# Altium schematic sheet Water.SchDoc
size A; SheetNumber: 1; SheetTotal: 2
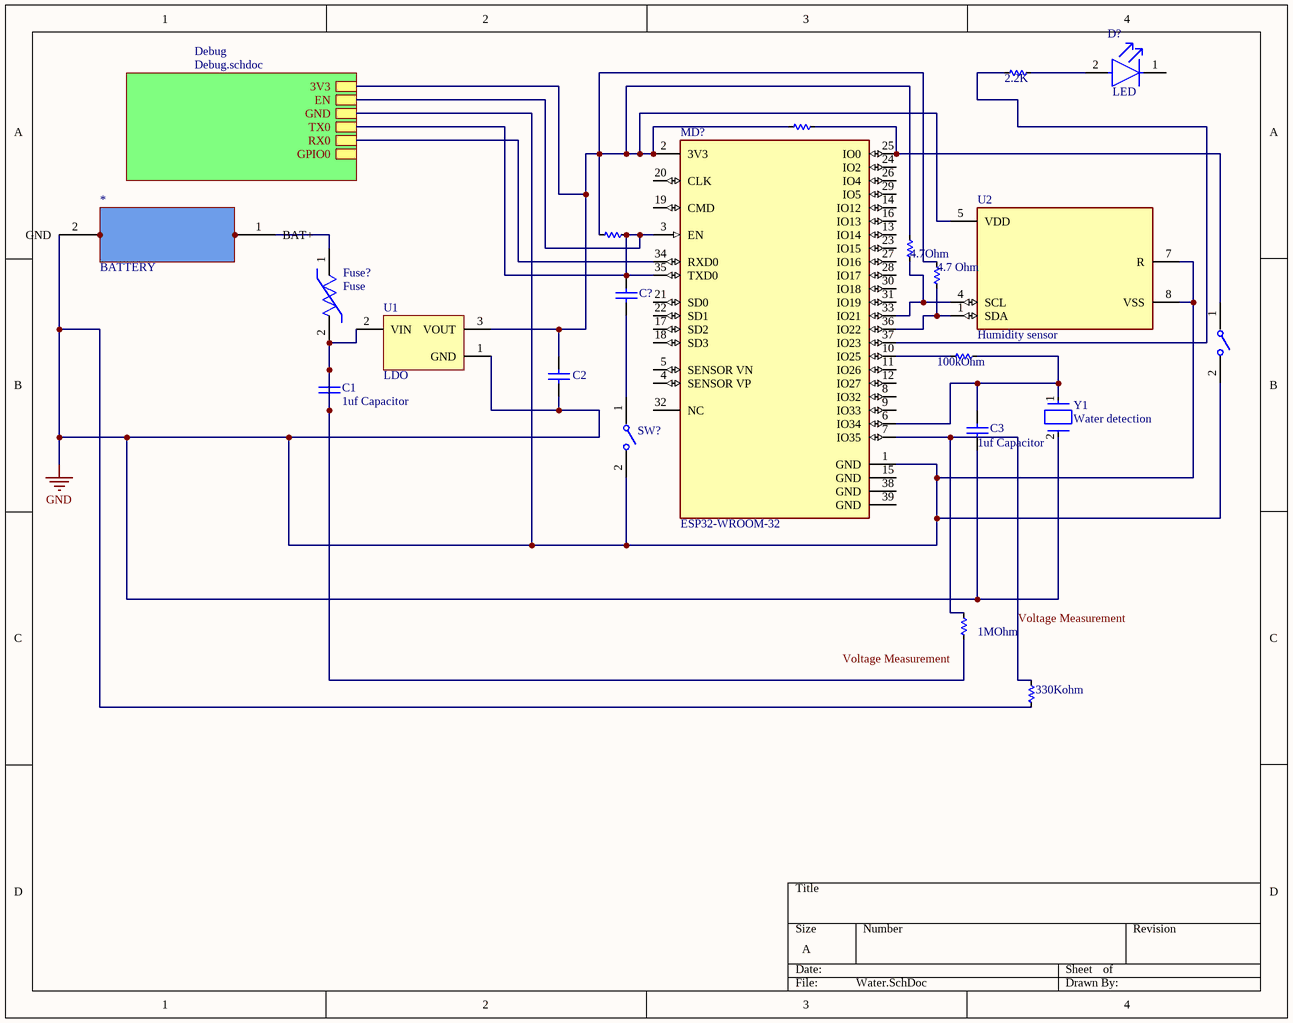
[diagram p0: Water.SchDoc]

## Parts
1MOhm  (no value)  [RESC_0603(1608)_020(0.5)]
2.2K  (no value)  [RESC_0603(1608)_020(0.5)]
4.7_Ohm  (no value)  [RESC_0603(1608)_020(0.5)]
4.7Ohm  (no value)  [RESC_0603(1608)_020(0.5)]
10kOhm  (no value)  [RESC_0603(1608)_020(0.5)]
100kOhm  (no value)  [RESC_0603(1608)_020(0.5)]
330Kohm  (no value)  [RESC_0603(1608)_020(0.5)]
*  BATTERY  [BATTERY_2PIN]
?  (no value)  [RESC_0603(1608)_020(0.5)]
C1  1uf Capacitor  [CAPC2013X140X50NL20T25]
C2  1uf Capacitor  [CAPC2013X140X50NL20T25]  (value not drawn)
C3  1uf Capacitor  [CAPC2013X140X50NL20T25]
C?  1uf  [CAPC2013X140X50NL20T25]  (value not drawn)
D?  LED  [FP-6_544-5255_01-4-MFG]
Fuse?  Fuse  [FP-RXEF250-MFG]
MD?  ESP32-WROOM-32  [FP-ESP32-WROOM-32-MFG]
reset_button  Reset Button  [FP-B3U-1000P-MFG]  (value not drawn)
SW?  Reset Button  [FP-B3U-1000P-MFG]  (value not drawn)
U1  LDO  [TO-92-TO3]
U2  Humidity sensor  [FP-SHT31-DIS-B2_5KS-MFG]
Y1  Water detection  [FP-ECX-64A-MFG]

## Sub-sheets
Debug = Debug.schdoc: 3V3, EN, GND, TX0, RX0, GPIO0

## Nets
GND: 330Kohm.1 *.2(GND) C2.1 C3.1 MD?.1(GND) reset_button.2 SW?.2 U1.1(GND) U2.7(R) U2.8(VSS) Y1.2(Out/In) ; sheet Debug/GND
Voltage Measurement: 1MOhm.1 330Kohm.2 MD?.7(IO35)
Net1MOhm_2: 1MOhm.2 C1.1 C1.2 Fuse?.2 U1.2(VIN)
Net2.2K_1: 2.2K.1 MD?.37(IO23)
Net2.2K_2: 2.2K.2 D?.2(A)
Net4.7_Ohm_1: 4.7_Ohm.1 4.7Ohm.1 10kOhm.2 ?.2 C2.2 MD?.2(3V3) U1.3(VOUT) U2.5(VDD) ; sheet Debug/3V3
Net4.7_Ohm_2: 4.7_Ohm.2 MD?.36(IO22) U2.1(SDA)
Net4.7Ohm_2: 4.7Ohm.2 MD?.33(IO21) U2.4(SCL)
Net10kOhm_1: 10kOhm.1 MD?.25(IO0) reset_button.1
Net100kOhm_1: 100kOhm.1 C3.2 MD?.6(IO34) Y1.1(In/Out)
Net100kOhm_2: 100kOhm.2 MD?.10(IO25)
Net*_1: *.1(BAT+) Fuse?.1
Net?_1: ?.1 C?.2 MD?.3(EN) MD?.35(TXD0) ; sheet Debug/EN, sheet Debug/TX0
NetC?_1: C?.1 SW?.1
NetMD?_34: MD?.34(RXD0) ; sheet Debug/RX0

Not connected (* = marked no-connect by the designer): D? 1(C); MD? 4(SENSOR_VP) 5(SENSOR_VN) 8(IO32) 9(IO33) 11(IO26) 12(IO27) 13(IO14) 14(IO12) 15(GND) 16(IO13) 17(SD2) 18(SD3) 19(CMD) 20(CLK) 21(SD0) 22(SD1) 23(IO15) 24(IO2) 26(IO4) 27(IO16) 28(IO17) 29(IO5) 30(IO18) 31(IO19) 32(NC) 38(GND) 39(GND)

## Notes on the sheet
- Labels drawn without touching a wire or pin: Voltage Measurement

## Library data of the parts
1MOhm 2.2K 4.7_Ohm 4.7Ohm 10kOhm 100kOhm 330Kohm ? = CMP-00408-1: Resistor, 1 kOhm, 1%, 1/10W, 0603; Manufacturer: Various; Resistance: 1k; Power: 100mW; Min Temperature: -55°C; Max Temperature: 155°C; AEC-Q200: Y; Composition: Thin Film; Height: 500µm; Features: Automotive AEC-Q200; Case: 0603; Mounting: SMT; Tolerance: 1%
* = Component_1: Chemistry: Li-ion; Voltage: 3.0-4.2V; Cells: 1S
C1-C3 C? = CMP-2007-04663-1: Part Number: 0805YD105MAT2A; Manufacturer: AVX Interconnect / Elco
D? = CMP-02520-000017-1: LED GREEN DIFFUSED T-1 T/H; Number of Elements: 1; Forward Voltage: 2.4V; Luminous Intensity: 2mcd; Reverse Voltage: 20V; Power Dissipation: 20mW; Dominant Wavelength: 575nm; Forward Current: 7mA; Viewing Angle: 50°; Test Current: 2mA; Number of Pins: 2; Lens Style: Diffused; Color: Green; Case/Package: T; Depth: 3.2mm; Length: 3.2mm; Number of LEDs: 1; Mount: Through Hole; Radiation Hardening: No; Max Operating Temperature: 100°C; RoHS Compliant: No; Min Operating Temperature: -40°C; Packaging: Tape and Reel
Fuse? = CMP-08606-000004-1: PTC RESET FUSE 72V 2.5A RADIAL; Manufacturer: Littelfuse; Manufacturer Part Number: RXEF250; Value: 0.05-0.13Ω; Current Rating: 40A; Trip Time: 15.6s; Trip Current: 5A; ComponentLink2Description: Datasheet; Package: 0; Resistance: 0.05-0.13Ω; Height: 25.4mm; Temperature Range High: +85°C; RoHS: TRUE; Category: Fuse; Octopart: https://octopart.com/rxef250-littelfuse-74215928; Device Class L1: Circuit Protection; Device Class L3: unset; ComponentLink2URL: https://www.littelfuse.com/~/media/electronics/datasheets/resettable_ptcs/littelfuse_ptc_radial_leaded_rxef_datasheet.pdf.pdf; Automotive: No; Lead Free: Yes; Ambient Temperature Range High: +85°C; Ambient Temperature Range Low: -40°C; Temperature Range Low: -40°C; Voltage Rating: 72V; Digikey Description: PTC RESET FUSE 72V 2.5A RADIAL; Hold Current: 2.5A; Temperature: -40°C to +85°C; Device Class L2: PTC Resettable Fuses
MD? = CMP-194065-000008-1: RX TXRX MOD WIFI SURFACE MOUNT; Frequency: 2.5GHz; Sensitivity: -98dBm; Operating Supply Voltage: 3.6V; Data Rate: 150Mbps; Weight: 0.088185oz; Package Quantity: 550; Min Operating Temperature: -40°C; Mount: Surface Mount; Max Operating Temperature: 85°C; Packaging: Cut Tape; Case/Package: SMD/SMT
reset_button SW? = CMP-2100-03586-2: SWITCH TACTILE SPST-NO 0.05A 12V; Contact Resistance: 100mR; Operating Force: 1.5N; Max Current Rating: 50mA; Switch Travel: 0.15mm; Actuator Type: Standard; Mechanical Life: 200000Cycles; Ratings: Dust Proof; Illumination Type: Non-Illuminated; Throw Configuration: SPST; Actuator Length: 0.4mm; Switch Function: Off-Mom; Height: 1.2mm; Width: 3mm; Weight: 0.000776oz; Contact Material: Silver; Max Voltage Rating (DC): 12V; Insulation Resistance: 100MR; Lead Free: Lead Free; Current Rating: 50mA; Termination: SMD/SMT; Length: 4mm; Voltage Rating (DC): 12V; Contact Current Rating: 50mA; Orientation: Straight; Depth: 2.5mm; Max Operating Temperature: 70°C; Packaging: Tape and Reel; Min Operating Temperature: -25°C; Package Quantity: 1; Mount: Surface Mount; Electrical Life: 200000Cycles
U1 = CMP-0136-00007-1: Low Quiescent Current LDO, 3-Pin TO-92, Extended TemperatureBAG; PackageReference: TO-92-TO3; PackageDescription: 3-Lead Plastic Transistor Outline (TO) [TO-92]; DatasheetVersion: revB, Feb-2007; PackageVersion: revBB, Aug-2009
U2 = CMP-144040-000009-1: SENSOR HUMID/TEMP 5V I2C 2% SMD; RoHS Compliant: Yes
Y1 = CMP-40224-000026-1: CRYSTAL 25.0000MHZ 18PF SMD; Frequency: 25MHz; Frequency Stability: 30ppm; Frequency Tolerance: 20ppm; ESR (Equivalent Series Resistance): 40R; Width: 0.138inch; Mount: Surface Mount; Load Capacitance: 18pF; Length: 0.236inch; Packaging: Cut Tape; Case/Package: SMD/SMT; Max Operating Temperature: 85°C; Height: 0.043inch; Min Operating Temperature: -40°C